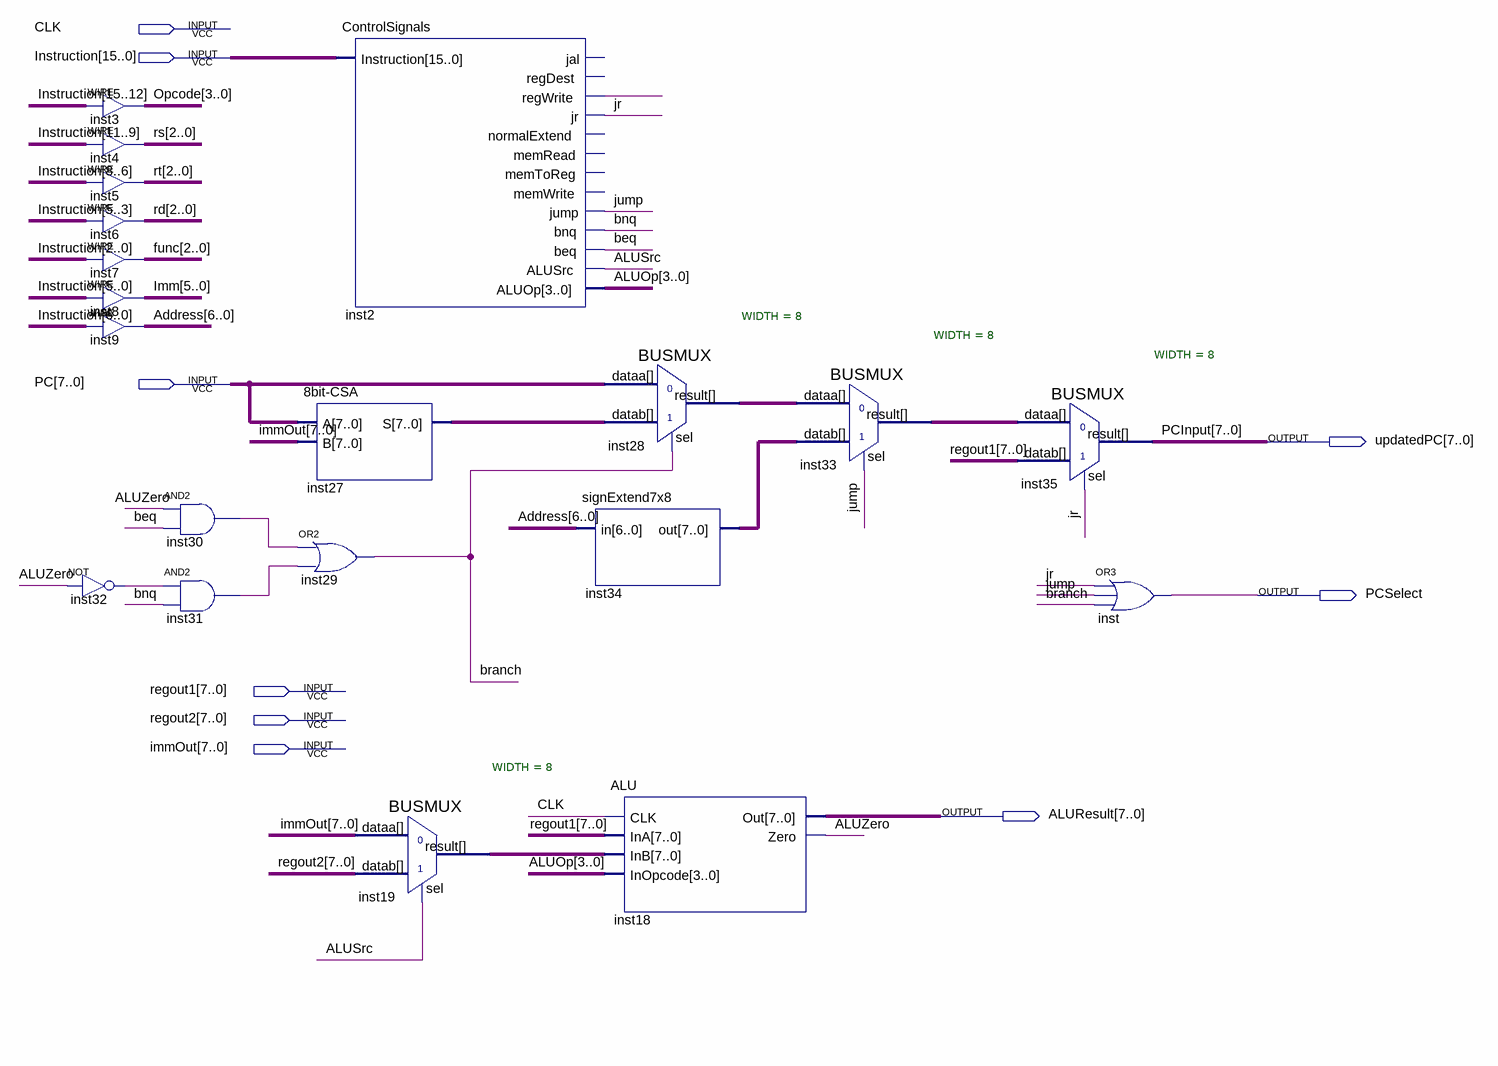
[diagram p0: schematic sheet]
// Quartus schematic Ex.bdf as structural Verilog: 20 symbols, 9 pins
module Ex (
  input  CLK,
  input  [15:0] Instruction,
  input  [7:0] PC,
  input  [7:0] regout1,
  input  [7:0] regout2,
  input  [7:0] immOut,
  output [7:0] updatedPC,
  output PCSelect,
  output [7:0] ALUResult
);

  wire ALUSrc, ALUZero, beq, bnq, branch, inst2_regwrite, inst30_out, inst31_out, inst32_out, jr, jump;
  wire [2:0] func, rd, rs, rt;
  wire [3:0] ALUOp, Opcode;
  wire [5:0] Imm;
  wire [6:0] Address;
  wire [7:0] inst19_result, inst27_s, inst28_result, inst33_result, inst34_out;

  assign Opcode = Instruction[15:12];  // WIRE inst3
  assign rs = Instruction[11:9];  // WIRE inst4
  assign rt = Instruction[8:6];  // WIRE inst5
  assign rd = Instruction[5:3];  // WIRE inst6
  assign func = Instruction[2:0];  // WIRE inst7
  assign Imm = Instruction[5:0];  // WIRE inst8
  assign Address = Instruction[6:0];  // WIRE inst9
  not inst32 (inst32_out, ALUZero);
  and inst30 (inst30_out, ALUZero, beq);
  and inst31 (inst31_out, inst32_out, bnq);
  ControlSignals inst2 (
    .Instruction(Instruction), .regWrite(inst2_regwrite), .jr(jr), .jump(jump), .bnq(bnq), .beq(beq),
    .ALUSrc(ALUSrc), .ALUOp(ALUOp));  // open: jal, regDest, normalExtend, memRead, memToReg, memWrite
  \8bit-CSA  inst27 (.A(PC), .B(immOut), .S(inst27_s));
  or inst29 (branch, inst30_out, inst31_out);
  BUSMUX #(.WIDTH(8)) inst19 (.datab(regout2), .sel(ALUSrc), .dataa(immOut), .result(inst19_result));
  signExtend7x8 inst34 (.in(Address), .out(inst34_out));
  BUSMUX #(.WIDTH(8)) inst28 (.datab(inst27_s), .sel(branch), .dataa(PC), .result(inst28_result));
  ALU inst18 (.CLK(CLK), .InA(regout1), .InB(inst19_result), .InOpcode(ALUOp), .Out(ALUResult), .Zero(ALUZero));
  BUSMUX #(.WIDTH(8)) inst33 (.datab(inst34_out), .sel(jump), .dataa(inst28_result), .result(inst33_result));
  BUSMUX #(.WIDTH(8)) inst35 (.datab(regout1), .sel(jr), .dataa(inst33_result), .result(updatedPC));
  or inst (PCSelect, jr, jump, branch);

  // Other names for the same wires on the sheet: PCInput[7:0] = updatedPC
endmodule
